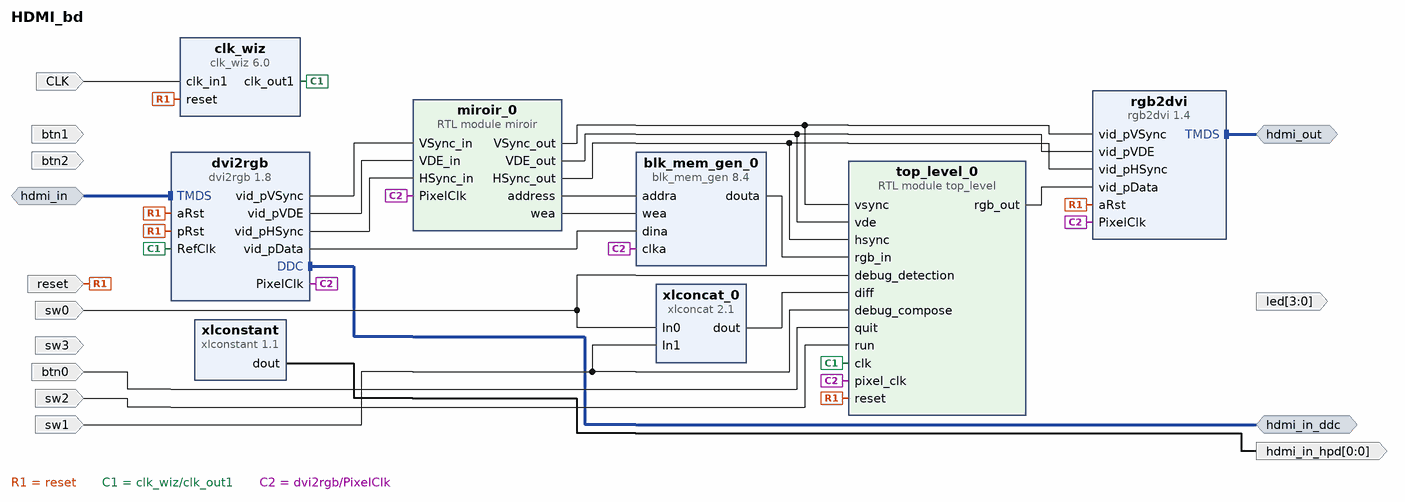
[diagram p0: block diagram of the top level]
# Vivado block design HDMI_bd, xc7z020clg400-1, Vivado 2018.2.1
create_bd_design HDMI_bd

create_bd_intf_port -mode Slave -vlnv digilentinc.com:interface:tmds_rtl:1.0 hdmi_in
create_bd_intf_port -mode Master -vlnv xilinx.com:interface:iic_rtl:1.0 hdmi_in_ddc
create_bd_intf_port -mode Master -vlnv digilentinc.com:interface:tmds_rtl:1.0 hdmi_out
create_bd_port -dir O -from 3 -to 0 led
create_bd_port -dir I btn2
create_bd_port -dir I sw2
create_bd_port -dir I sw3
create_bd_port -dir O -from 0 -to 0 hdmi_in_hpd
create_bd_port -dir I -type rst reset
set_property -dict {CONFIG.POLARITY ACTIVE_HIGH} [get_bd_ports reset]
create_bd_port -dir I -type clk CLK
set_property -dict {CONFIG.FREQ_HZ 125000000} [get_bd_ports CLK]
create_bd_port -dir I btn0
create_bd_port -dir I btn1
create_bd_port -dir I sw0
create_bd_port -dir I sw1

create_bd_cell -type ip -vlnv xilinx.com:ip:xlconstant:1.1 xlconstant
create_bd_cell -type ip -vlnv digilentinc.com:ip:rgb2dvi:1.4 rgb2dvi
set_property -dict {CONFIG.kClkPrimitive MMCM CONFIG.kClkRange 3} [get_bd_cells rgb2dvi]
create_bd_cell -type ip -vlnv digilentinc.com:ip:dvi2rgb:1.8 dvi2rgb
create_bd_cell -type ip -vlnv xilinx.com:ip:clk_wiz:6.0 clk_wiz
set_property -dict [list \
  CONFIG.PRIMITIVE PLL \
  CONFIG.PRIM_IN_FREQ 125.000 \
  CONFIG.CLKIN1_JITTER_PS 80.0 \
  CONFIG.CLKOUT1_REQUESTED_OUT_FREQ 200.000 \
  CONFIG.CLKOUT1_DRIVES BUFG \
  CONFIG.CLKOUT2_DRIVES BUFG \
  CONFIG.CLKOUT3_DRIVES BUFG \
  CONFIG.CLKOUT4_DRIVES BUFG \
  CONFIG.CLKOUT5_DRIVES BUFG \
  CONFIG.CLKOUT6_DRIVES BUFG \
  CONFIG.CLKOUT7_DRIVES BUFG \
  CONFIG.MMCM_DIVCLK_DIVIDE 1 \
  CONFIG.MMCM_CLKFBOUT_MULT_F 8 \
  CONFIG.MMCM_CLKIN1_PERIOD 8.000 \
  CONFIG.MMCM_CLKIN2_PERIOD 10.0 \
  CONFIG.MMCM_COMPENSATION ZHOLD \
  CONFIG.MMCM_CLKOUT0_DIVIDE_F 5 \
  CONFIG.CLKOUT1_JITTER 109.241 \
  CONFIG.CLKOUT1_PHASE_ERROR 96.948 \
] [get_bd_cells clk_wiz]
create_bd_cell -type module -reference miroir miroir_0
create_bd_cell -type ip -vlnv xilinx.com:ip:blk_mem_gen:8.4 blk_mem_gen_0
set_property -dict [list \
  CONFIG.Enable_32bit_Address false \
  CONFIG.Use_Byte_Write_Enable false \
  CONFIG.Write_Width_A 24 \
  CONFIG.Write_Depth_A 1600 \
  CONFIG.Read_Width_A 24 \
  CONFIG.Operating_Mode_A READ_FIRST \
  CONFIG.Enable_A Always_Enabled \
  CONFIG.Register_PortA_Output_of_Memory_Primitives true \
  CONFIG.Use_RSTA_Pin false \
  CONFIG.use_bram_block Stand_Alone \
] [get_bd_cells blk_mem_gen_0]
create_bd_cell -type ip -vlnv xilinx.com:ip:xlconcat:2.1 xlconcat_0
create_bd_cell -type module -reference top_level top_level_0

# ---- connections ----

connect_bd_intf_net [get_bd_intf_ports hdmi_in] [get_bd_intf_pins dvi2rgb/TMDS]
connect_bd_intf_net -intf_net dvi2rgb_1_DDC [get_bd_intf_ports hdmi_in_ddc] [get_bd_intf_pins dvi2rgb/DDC]
connect_bd_intf_net -intf_net rgb2dvi_1_TMDS [get_bd_intf_ports hdmi_out] [get_bd_intf_pins rgb2dvi/TMDS]
connect_bd_net -net xlconstant_0_dout [get_bd_pins xlconstant/dout] [get_bd_ports hdmi_in_hpd]
connect_bd_net [get_bd_ports reset] \
  [get_bd_pins rgb2dvi/aRst] [get_bd_pins dvi2rgb/aRst] [get_bd_pins dvi2rgb/pRst] [get_bd_pins clk_wiz/reset] \
  [get_bd_pins top_level_0/reset]
connect_bd_net [get_bd_ports CLK] [get_bd_pins clk_wiz/clk_in1]
connect_bd_net -net clk_wiz_1_clk_out1 [get_bd_pins clk_wiz/clk_out1] [get_bd_pins dvi2rgb/RefClk] [get_bd_pins top_level_0/clk]
connect_bd_net [get_bd_pins dvi2rgb/PixelClk] \
  [get_bd_pins rgb2dvi/PixelClk] [get_bd_pins miroir_0/PixelClk] [get_bd_pins blk_mem_gen_0/clka] \
  [get_bd_pins top_level_0/pixel_clk]
connect_bd_net [get_bd_pins miroir_0/VSync_out] [get_bd_pins rgb2dvi/vid_pVSync] [get_bd_pins top_level_0/vsync]
connect_bd_net [get_bd_pins miroir_0/VDE_out] [get_bd_pins rgb2dvi/vid_pVDE] [get_bd_pins top_level_0/vde]
connect_bd_net [get_bd_pins miroir_0/HSync_out] [get_bd_pins rgb2dvi/vid_pHSync] [get_bd_pins top_level_0/hsync]
connect_bd_net [get_bd_pins miroir_0/address] [get_bd_pins blk_mem_gen_0/addra]
connect_bd_net [get_bd_pins miroir_0/wea] [get_bd_pins blk_mem_gen_0/wea]
connect_bd_net [get_bd_pins dvi2rgb/vid_pVSync] [get_bd_pins miroir_0/VSync_in]
connect_bd_net [get_bd_pins dvi2rgb/vid_pVDE] [get_bd_pins miroir_0/VDE_in]
connect_bd_net [get_bd_pins dvi2rgb/vid_pHSync] [get_bd_pins miroir_0/HSync_in]
connect_bd_net [get_bd_pins dvi2rgb/vid_pData] [get_bd_pins blk_mem_gen_0/dina]
connect_bd_net [get_bd_pins top_level_0/rgb_out] [get_bd_pins rgb2dvi/vid_pData]
connect_bd_net [get_bd_pins blk_mem_gen_0/douta] [get_bd_pins top_level_0/rgb_in]
connect_bd_net -net btn0_1 [get_bd_ports btn0] [get_bd_pins top_level_0/quit]
connect_bd_net [get_bd_pins xlconcat_0/dout] [get_bd_pins top_level_0/diff]
connect_bd_net -net sw2_1 [get_bd_ports sw2] [get_bd_pins top_level_0/run]
connect_bd_net -net sw0_1 [get_bd_ports sw0] [get_bd_pins xlconcat_0/In0] [get_bd_pins top_level_0/debug_detection]
connect_bd_net -net sw1_1 [get_bd_ports sw1] [get_bd_pins xlconcat_0/In1] [get_bd_pins top_level_0/debug_compose]

validate_bd_design
save_bd_design
